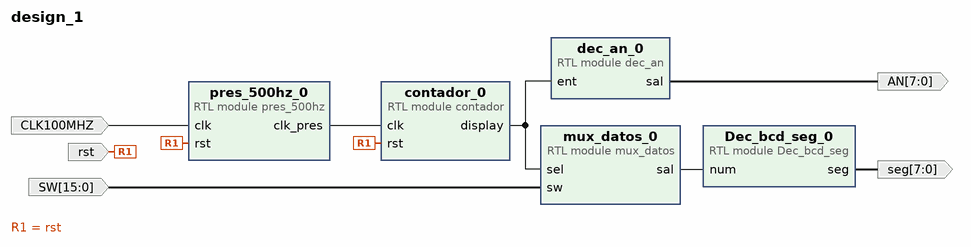
[diagram p0: block diagram of the top level]
# Vivado block design design_1, xc7a100tcsg324-1, Vivado 2026.1
create_bd_design design_1

create_bd_port -dir I -type clk CLK100MHZ
create_bd_port -dir I -type rst rst
create_bd_port -dir I -from 15 -to 0 SW
create_bd_port -dir O -from 7 -to 0 seg
create_bd_port -dir O -from 7 -to 0 AN

create_bd_cell -type module -reference contador contador_0
create_bd_cell -type module -reference Dec_bcd_seg Dec_bcd_seg_0
create_bd_cell -type module -reference mux_datos mux_datos_0
create_bd_cell -type module -reference pres_500hz pres_500hz_0
create_bd_cell -type module -reference dec_an dec_an_0

# ---- connections ----

connect_bd_net [get_bd_pins Dec_bcd_seg_0/seg] [get_bd_ports seg]
connect_bd_net [get_bd_pins contador_0/display] [get_bd_pins mux_datos_0/sel] [get_bd_pins dec_an_0/ent]
connect_bd_net -net clk_0_1 [get_bd_ports CLK100MHZ] [get_bd_pins pres_500hz_0/clk]
connect_bd_net [get_bd_pins dec_an_0/sal] [get_bd_ports AN]
connect_bd_net [get_bd_pins mux_datos_0/sal] [get_bd_pins Dec_bcd_seg_0/num]
connect_bd_net [get_bd_pins pres_500hz_0/clk_pres] [get_bd_pins contador_0/clk]
connect_bd_net -net rst_0_1 [get_bd_ports rst] [get_bd_pins pres_500hz_0/rst] [get_bd_pins contador_0/rst]
connect_bd_net -net sw_0_1 [get_bd_ports SW] [get_bd_pins mux_datos_0/sw]

validate_bd_design
save_bd_design
